# Altium schematic sheet sens.SchDoc: SENS
size A4; CompanyName: AGH University of Krakow; Engineer: Jakub Kwiecień; Revision: 1; SheetNumber: 4; SheetTotal: 4
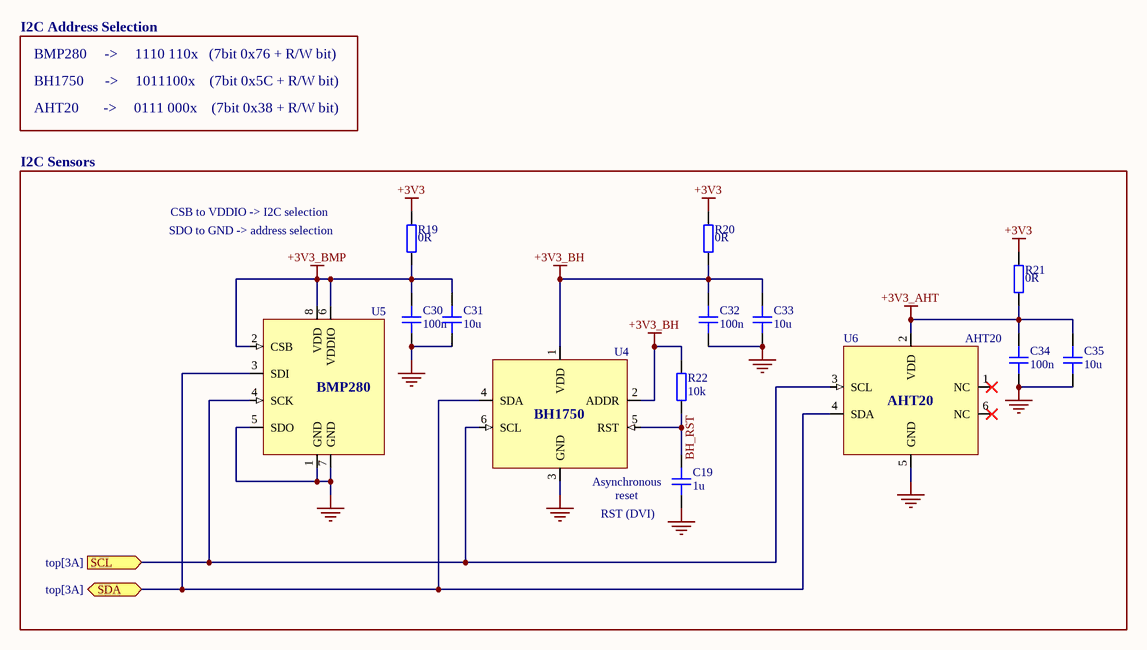
[diagram p0: sens.SchDoc]

## Parts
C19  1u  [CAP_0603]
C30  100n  [CAP_0603]
C31  10u  [CAP_0603]
C32  100n  [CAP_0603]
C33  10u  [CAP_0603]
C34  100n  [CAP_0603]
C35  10u  [CAP_0603]
R19  0R  [RES_0603]
R20  0R  [RES_0603]
R21  0R  [RES_0603]
R22  10k  [RES_0603]
U4  BH1750  [BH1750]  (value not drawn)
U5  BMP280  [BMP280]  (value not drawn)
U6  AHT20  [AHT20]

## Ports
SCL (in, see top[3A]), SDA (bidir, see top[3A])

## Nets
+3V3: R19.1 R20.1 R21.1
+3V3_AHT: C34.2 C35.2 R21.2 U6.2(VDD)
+3V3_BH: C32.2 C33.2 R20.2 R22.2 U4.1(VDD) U4.2(ADDR)
+3V3_BMP: C30.2 C31.2 R19.2 U5.2(CSB) U5.6(VDDIO) U5.8(VDD)
GND: C19.1 C30.1 C31.1 C32.1 C33.1 C34.1 C35.1 U4.3(GND) U5.1(GND) U5.5(SDO) U5.7(GND) U6.5(GND)
BH_RST: C19.2 R22.1 U4.5(RST)
SCL: U4.6(SCL) U5.4(SCK) U6.3(SCL) ; port SCL
SDA: U4.4(SDA) U5.3(SDI) U6.4(SDA) ; port SDA

Not connected (* = marked no-connect by the designer): U6 1(NC)* 6(NC)*

## Notes on the sheet
- I2C Address Selection
- BMP280     ->     1110 110x   (7bit 0x76 + R/W bit)
- BH1750      ->     1011100x    (7bit 0x5C + R/W bit)
- AHT20       ->     0111 000x    (7bit 0x38 + R/W bit)
- I2C Sensors
- SDO to GND -> address selection
- CSB to VDDIO -> I2C selection
- RST (DVI)
- (near U4) Asynchronous
- (near U4) reset
- Project name:
- Title:
- Company:
- Engineer:
- Modified:
- Revision:

## Library data of the parts
C19 = CAP_0603: Capacitor SMD 0603; Manufacturer: SAMSUNG; Manufacturer Part Number: CL10B105KO8NNND; ComponentLink1Description: Distributor Link; ComponentLink1URL: https://www.tme.eu/pl/details/cl10b105ko8nnnd/kondensatory-mlcc-smd/samsung/
C30-C35 = CAP_0603: Capacitor SMD 0603; Manufacturer: SAMSUNG; Manufacturer Part Number: *; ComponentLink1Description: Distributor Link
  C30 C32 C34: ComponentLink1URL: https://www.tme.eu/pl/details/cl10b104kb8nnnc/kondensatory-mlcc-smd/samsung/
  C31 C33 C35: ComponentLink1URL: https://www.tme.eu/pl/details/cl10a106mo8nqnc/kondensatory-mlcc-smd/samsung/
R19-R21 = RES_0603: Resistor SMD 0603; Manufacturer: YAEGO; Manufacturer Part Number: AC0603JR-070RL; ComponentLink1Description: Distributor Link; ComponentLink1URL: https://www.tme.eu/pl/details/ac0603jr-070rl/rezystory-smd/yageo/
R22 = RES_0603: Resistor SMD 0603; Manufacturer: YAEGO; Manufacturer Part Number: RC0603FR-0710KL; ComponentLink1Description: Distributor Link; ComponentLink1URL: https://www.tme.eu/pl/details/rc0603fr-0710k/rezystory-smd/yageo/rc0603fr-0710kl/
U4 = BH1750: Light-to-digital converter; Manufacturer: ROHM; Manufacturer Part Number: BH1750; ComponentLink1Description: Distributor Link; ComponentLink1URL: https://botland.com.pl/czujniki-swiatla-i-koloru/2024-czujnik-natezenia-swiatla-bh1750-5904422373283.html; ComponentLink2Description: Datasheet
U5 = BMP280: Digital pressure sensor; Manufacturer: Bosch; Manufacturer Part Number: BMP280; ComponentLink1Description: Distributor Link; ComponentLink1URL: https://botland.com.pl/czujniki-cisnienia/7245-bmp280-cyfrowy-barometr-czujnik-cisnienia-110kpa-i2cspi-33v-5904422310042.html?cd=20567593583&ad=&kd=&gad_source=1&gclid=CjwKCAjwp8--BhBREiwAj7og1-nRhMJoqo2958cRfqefQLetJBOYS6mwdGBl99UBbPsT0KdtvAyqfhoCL9cQAvD_BwE; ComponentLink2Description: Datasheet
U6 = AHT20: Temperature and humidity sensor; Manufacturer: ASAIR; Manufacturer Part Number: AHT20; ComponentLink1Description: Distributor Link; ComponentLink1URL: https://botland.com.pl/cyfrowe-czujniki-temperatury/21922-fermion-czujnik-temperatury-i-wilgotnosci-aht20-dfrobot-sen0527-6959420922611.html; ComponentLink2Description: Datasheet; ComponentLink2URL: https://files.seeedstudio.com/wiki/Grove-AHT20_I2C_Industrial_Grade_Temperature_and_Humidity_Sensor/AHT20-datasheet-2020-4-16.pdf